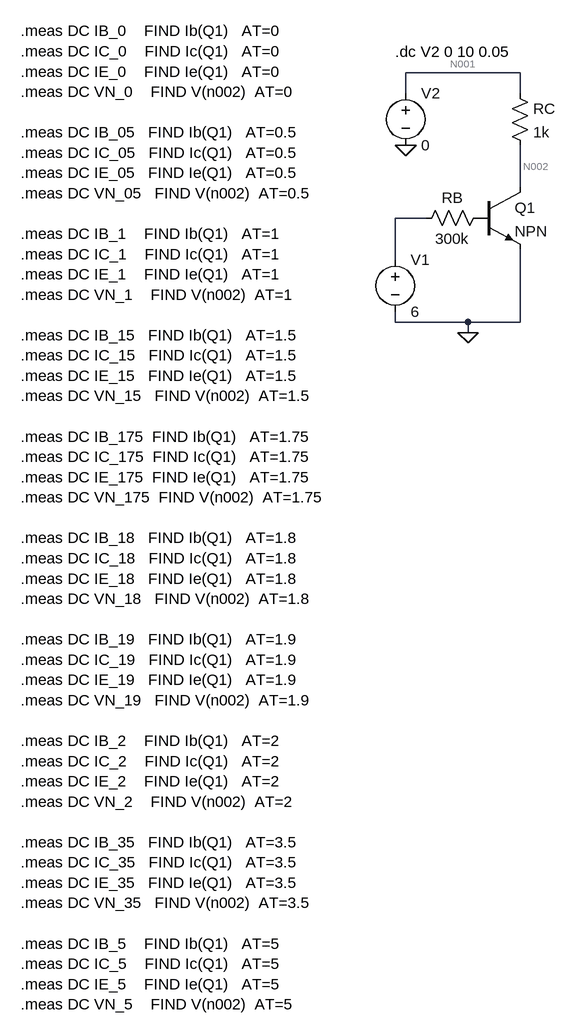
[diagram p0: schematic bjt_commoncollect.asc]
bjt_commoncollect.asc, the LTspice schematic file:
Version 4
SHEET 1 880 1392
WIRE 368 96 192 96
WIRE 192 128 192 96
WIRE 368 128 368 96
WIRE 368 272 368 208
WIRE 224 320 176 320
WIRE 176 384 176 320
WIRE 176 480 176 464
WIRE 288 480 176 480
WIRE 368 480 368 368
WIRE 368 480 288 480
WIRE 288 496 288 480
FLAG 192 208 0
FLAG 288 496 0
SYMBOL voltage 192 112 R0
SYMATTR InstName V2
SYMATTR Value 0
SYMBOL res 352 112 R0
SYMATTR InstName RC
SYMATTR Value 1k
SYMBOL res 320 304 R90
WINDOW 0 0 56 VBottom 2
WINDOW 3 32 56 VTop 2
SYMATTR InstName RB
SYMATTR Value 300k
SYMBOL voltage 176 368 R0
WINDOW 123 0 0 Left 0
WINDOW 39 0 0 Left 0
SYMATTR InstName V1
SYMATTR Value 6
SYMBOL npn 304 272 R0
SYMATTR InstName Q1
TEXT 176 64 Left 2 !.dc V2 0 10 0.05
TEXT -400 32 Left 2 !.meas DC IB_0    FIND Ib(Q1)   AT=0\n.meas DC IC_0    FIND Ic(Q1)   AT=0\n.meas DC IE_0    FIND Ie(Q1)   AT=0\n.meas DC VN_0    FIND V(n002)  AT=0\n \n.meas DC IB_05   FIND Ib(Q1)   AT=0.5\n.meas DC IC_05   FIND Ic(Q1)   AT=0.5\n.meas DC IE_05   FIND Ie(Q1)   AT=0.5\n.meas DC VN_05   FIND V(n002)  AT=0.5\n \n.meas DC IB_1    FIND Ib(Q1)   AT=1\n.meas DC IC_1    FIND Ic(Q1)   AT=1\n.meas DC IE_1    FIND Ie(Q1)   AT=1\n.meas DC VN_1    FIND V(n002)  AT=1\n \n.meas DC IB_15   FIND Ib(Q1)   AT=1.5\n.meas DC IC_15   FIND Ic(Q1)   AT=1.5\n.meas DC IE_15   FIND Ie(Q1)   AT=1.5\n.meas DC VN_15   FIND V(n002)  AT=1.5\n \n.meas DC IB_175  FIND Ib(Q1)   AT=1.75\n.meas DC IC_175  FIND Ic(Q1)   AT=1.75\n.meas DC IE_175  FIND Ie(Q1)   AT=1.75\n.meas DC VN_175  FIND V(n002)  AT=1.75\n \n.meas DC IB_18   FIND Ib(Q1)   AT=1.8\n.meas DC IC_18   FIND Ic(Q1)   AT=1.8\n.meas DC IE_18   FIND Ie(Q1)   AT=1.8\n.meas DC VN_18   FIND V(n002)  AT=1.8\n \n.meas DC IB_19   FIND Ib(Q1)   AT=1.9\n.meas DC IC_19   FIND Ic(Q1)   AT=1.9\n.meas DC IE_19   FIND Ie(Q1)   AT=1.9\n.meas DC VN_19   FIND V(n002)  AT=1.9\n \n.meas DC IB_2    FIND Ib(Q1)   AT=2\n.meas DC IC_2    FIND Ic(Q1)   AT=2\n.meas DC IE_2    FIND Ie(Q1)   AT=2\n.meas DC VN_2    FIND V(n002)  AT=2\n \n.meas DC IB_35   FIND Ib(Q1)   AT=3.5\n.meas DC IC_35   FIND Ic(Q1)   AT=3.5\n.meas DC IE_35   FIND Ie(Q1)   AT=3.5\n.meas DC VN_35   FIND V(n002)  AT=3.5\n \n.meas DC IB_5    FIND Ib(Q1)   AT=5\n.meas DC IC_5    FIND Ic(Q1)   AT=5\n.meas DC IE_5    FIND Ie(Q1)   AT=5\n.meas DC VN_5    FIND V(n002)  AT=5

The netlist it stands for:
* bjt_commoncollect.asc
V2 N001 0 0
RC N001 N002 1k
RB P001 N003 300k
V1 N003 0 6
Q1 N002 P001 0 0 NPN
.model NPN NPN
.model PNP PNP
.lib standard.bjt
.dc V2 0 10 0.05
.meas DC IB_0    FIND Ib(Q1)   AT=0
.meas DC IC_0    FIND Ic(Q1)   AT=0
.meas DC IE_0    FIND Ie(Q1)   AT=0
.meas DC VN_0    FIND V(n002)  AT=0
.meas DC IB_05   FIND Ib(Q1)   AT=0.5
.meas DC IC_05   FIND Ic(Q1)   AT=0.5
.meas DC IE_05   FIND Ie(Q1)   AT=0.5
.meas DC VN_05   FIND V(n002)  AT=0.5
.meas DC IB_1    FIND Ib(Q1)   AT=1
.meas DC IC_1    FIND Ic(Q1)   AT=1
.meas DC IE_1    FIND Ie(Q1)   AT=1
.meas DC VN_1    FIND V(n002)  AT=1
.meas DC IB_15   FIND Ib(Q1)   AT=1.5
.meas DC IC_15   FIND Ic(Q1)   AT=1.5
.meas DC IE_15   FIND Ie(Q1)   AT=1.5
.meas DC VN_15   FIND V(n002)  AT=1.5
.meas DC IB_175  FIND Ib(Q1)   AT=1.75
.meas DC IC_175  FIND Ic(Q1)   AT=1.75
.meas DC IE_175  FIND Ie(Q1)   AT=1.75
.meas DC VN_175  FIND V(n002)  AT=1.75
.meas DC IB_18   FIND Ib(Q1)   AT=1.8
.meas DC IC_18   FIND Ic(Q1)   AT=1.8
.meas DC IE_18   FIND Ie(Q1)   AT=1.8
.meas DC VN_18   FIND V(n002)  AT=1.8
.meas DC IB_19   FIND Ib(Q1)   AT=1.9
.meas DC IC_19   FIND Ic(Q1)   AT=1.9
.meas DC IE_19   FIND Ie(Q1)   AT=1.9
.meas DC VN_19   FIND V(n002)  AT=1.9
.meas DC IB_2    FIND Ib(Q1)   AT=2
.meas DC IC_2    FIND Ic(Q1)   AT=2
.meas DC IE_2    FIND Ie(Q1)   AT=2
.meas DC VN_2    FIND V(n002)  AT=2
.meas DC IB_35   FIND Ib(Q1)   AT=3.5
.meas DC IC_35   FIND Ic(Q1)   AT=3.5
.meas DC IE_35   FIND Ie(Q1)   AT=3.5
.meas DC VN_35   FIND V(n002)  AT=3.5
.meas DC IB_5    FIND Ib(Q1)   AT=5
.meas DC IC_5    FIND Ic(Q1)   AT=5
.meas DC IE_5    FIND Ie(Q1)   AT=5
.meas DC VN_5    FIND V(n002)  AT=5
.backanno
.end

* Results of the author's LTspice run, read from the files saved beside the schematic
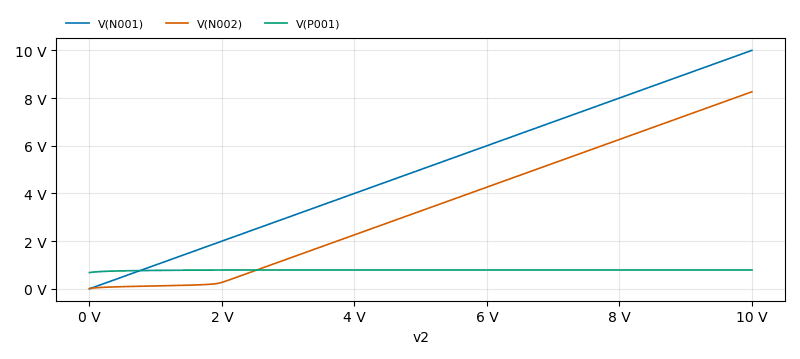
[diagram p1: DC transfer characteristic of bjt_commoncollect.asc, plotted from the saved traces]
* DC transfer characteristic, 1 run:
*   V(N001): 0 V at v2=0 V, 10 V at v2=10 V, min 0 V, max 10 V
*   V(N002): 9.613 mV at v2=0 V, 8.263 V at v2=10 V, min 9.613 mV, max 8.263 V
*   V(P001): 679.2 mV at v2=0 V, 788.5 mV at v2=10 V, min 679.2 mV, max 788.5 mV
* From the log:
*   ib_0: ib(q1)=1.77361e-005 at 0
*   ic_0: ic(q1)=-9.61296e-006 at 0
*   ie_0: ie(q1)=-8.1231e-006 at 0
*   vn_0: v(n002)=0.00961296 at 0
*   ib_05: ib(q1)=1.74909e-005 at 0.5
*   ic_05: ic(q1)=0.000409428 at 0.5
*   ie_05: ie(q1)=-0.000426918 at 0.5
*   vn_05: v(n002)=0.0905744 at 0.5
*   ib_1: ib(q1)=1.74287e-005 at 1
*   ic_1: ic(q1)=0.000879409 at 1
*   ie_1: ie(q1)=-0.000896837 at 1
*   vn_1: v(n002)=0.120591 at 1
*   ib_15: ib(q1)=1.7393e-005 at 1.5
*   ic_15: ic(q1)=0.00134822 at 1.5
*   ie_15: ie(q1)=-0.00136561 at 1.5
*   vn_15: v(n002)=0.151781 at 1.5
*   ib_175: ib(q1)=1.738e-005 at 1.75
*   ic_175: ic(q1)=0.00157215 at 1.75
*   ie_175: ie(q1)=-0.00158953 at 1.75
*   vn_175: v(n002)=0.177833 at 1.75
*   ib_18: ib(q1)=1.73778e-005 at 1.8
*   ic_18: ic(q1)=0.00161393 at 1.8
*   ie_18: ie(q1)=-0.00163131 at 1.8
*   vn_18: v(n002)=0.18603 at 1.8
*   ib_19: ib(q1)=1.7374e-005 at 1.9
*   ic_19: ic(q1)=0.00168866 at 1.9
*   ie_19: ie(q1)=-0.00170604 at 1.9
*   vn_19: v(n002)=0.211336 at 1.9
*   ib_2: ib(q1)=1.73719e-005 at 2
*   ic_2: ic(q1)=0.00173167 at 2
*   ie_2: ie(q1)=-0.00174904 at 2
*   vn_2: v(n002)=0.268326 at 2
*   ib_35: ib(q1)=1.73716e-005 at 3.5
*   ic_35: ic(q1)=0.00173716 at 3.5
*   ie_35: ie(q1)=-0.00175453 at 3.5
*   vn_35: v(n002)=1.76284 at 3.5
*   ib_5: ib(q1)=1.73716e-005 at 5
*   ic_5: ic(q1)=0.00173716 at 5
*   ie_5: ie(q1)=-0.00175453 at 5
*   vn_5: v(n002)=3.26284 at 5